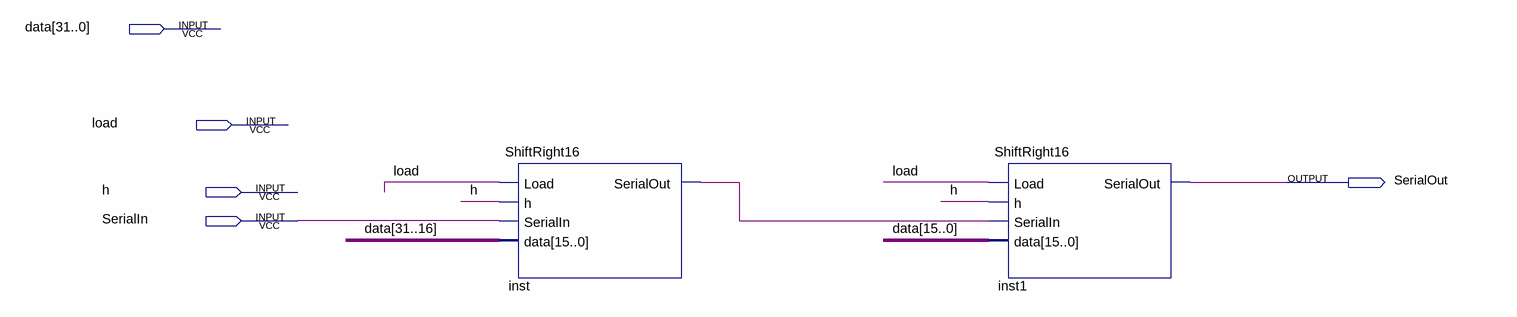
[diagram p0: schematic sheet]
// Quartus schematic ShiftRight32.bdf as structural Verilog: 2 symbols, 5 pins
module ShiftRight32 (
  input  [31:0] data,
  input  load,
  input  h,
  input  SerialIn,
  output SerialOut
);

  wire inst_serialout;

  ShiftRight16 inst (.Load(load), .h(h), .SerialIn(SerialIn), .data(data[31:16]), .SerialOut(inst_serialout));
  ShiftRight16 inst1 (.Load(load), .h(h), .SerialIn(inst_serialout), .data(data[15:0]), .SerialOut(SerialOut));
endmodule
